# EAGLE design ESP181A (EAGLE 9.6.2)
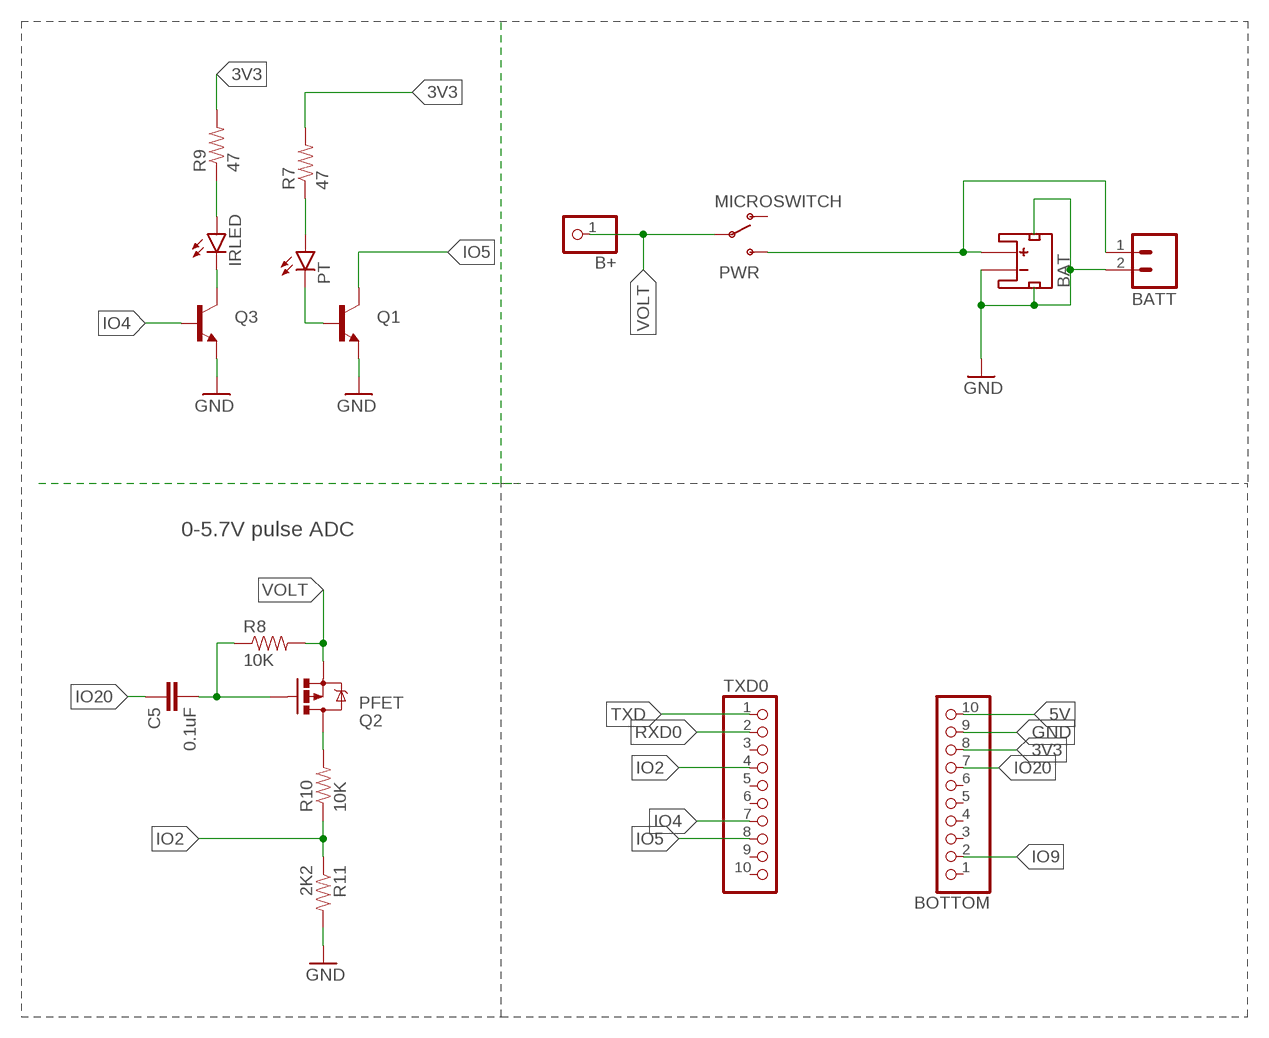
[diagram p0: schematic, sheet 1]

## Parts
B+  PINHD-1X1  [1X01]
BAT  JST1.25MM  [JST_1.25MM]
BATT  M02PTH  [1X02]
BOTTOM  PINHD-1X10  [1X10]
C5  0.1uF  CAP  [0805-CAP]
IRLED  LED3MM  [LED3MM]
PT  LED3MM  [LED3MM]
PWR  MICROSWITCH  [MICROSWITCH]
Q1  TRANSISTOR_NPNSOT23-3  [SOT23-3]
Q2  PFET  MOSFET-PCHANNEL  [SOT23-3]
Q3  TRANSISTOR_NPNSOT23-3  [SOT23-3]
R7  47  RESISTOR0805-RES  [0805]
R8  10K  RESISTOR0805-RES  [0805]
R9  47  RESISTOR0805-RES  [0805]
R10  10K  RESISTOR0805-RES  [0805]
R11  2K2  RESISTOR0805-RES  [0805]
TXD0  PINHD-1X10  [1X10]

## Nets
3V3: BOTTOM.8 R7.2 R9.2
5V: BOTTOM.10
GND: BAT.1(-) BAT.NC1(PAD1) BAT.NC2(PAD2) BATT.2 BOTTOM.9 Q1.2(E) Q3.2(E) R11.2
IO2: R10.1 R11.1 TXD0.4
IO4: Q3.1(B) TXD0.7
IO5: Q1.3(C) TXD0.8
IO9: BOTTOM.2
IO20: BOTTOM.7 C5.1
N$1: IRLED.A R9.1
N$2: PT.K(C) Q1.1(B)
N$5: BAT.2(+) BATT.1 PWR.3(S)
N$11: PT.A R7.1
N$12: C5.2 Q2.1(G) R8.1
N$13: Q2.3(D) R10.2
N$14: IRLED.K(C) Q3.3(C)
RXD0: TXD0.2
TXD: TXD0.1
VOLT: B+.1 PWR.2(P) Q2.2(S) R8.2
Unconnected: BOTTOM.1 BOTTOM.3 BOTTOM.4 BOTTOM.5 BOTTOM.6 PWR.1(O) TXD0.3 TXD0.5 TXD0.6 TXD0.9 TXD0.10

## Notes on the sheet
- 0-5.7V pulse ADC

## Library data of the parts
B+ = pinhead:PINHD-1X1: PIN HEADER
BAT = CuriousTech:JST1.25MM
BATT = SparkFun-Connectors:M02: Standard 2-pin 0.1" header. Use with - straight break away headers ( PRT-00116) - right angle break away headers (PRT-00553) - swiss pins (PRT-00743) - machine pins (PRT-00117) - female headers (PRT-00115) Molex polarized connector foot print use with: PRT-08233 with associated crimp pins and housings. 2.54_SCREWTERM for use with PRT-10571. 3.5mm Screw Terminal footprints for PRT-08084 5mm Screw Terminal footprints for use with PRT-08432
BOTTOM TXD0 = pinhead:PINHD-1X10: PIN HEADER
C5 = SparkFun-Capacitors:CAP: Capacitor Standard 0603 ceramic capacitor, and 0.1" leaded capacitor.
IRLED PT = SparkFun-LED:LED: LEDs Standard schematic elements and footprints for 5mm, 3mm, 1206, and 0603 sized LEDs. 5mm - Spark Fun Electronics SKU : COM-00529 (and others); PROD_ID: DIO-08794
PWR = CuriousTech:MICROSWITCH: 2 pole micro switch
Q1 Q3 = SparkFun-DiscreteSemi:TRANSISTOR_NPN: Generic NPN BJT MMBT2222A - TRANS-08049 (SOT-23, 1A 40V) MPSA42 - TRANS-09116 (SOT-23, 500mA 300V) MMBT5088LT1G - TRANS-11160 (SOT-23, 50 mA 30V) BC547 - COM-08928 <http://www.sparkfun.com/products/8928> (TO-92 45V 100mA) (1.Collector 2.Base 3.Emitter) 2N3904 - COM-00521 <http://www.sparkfun.com/products/521> (TO-92 40V 200mA) (1.Emitter 2.Base 3.Collector) P2N2222A - COM-12852 <http://www.sparkfun.com/products/12852> (TO-92 40V 600mA) (1.Collector 2.Base 3.Emitter); PROD_ID: TRANS-08049
Q2 = SparkFun-DiscreteSemi:MOSFET-PCHANNEL: Generic PMOSFET IRLML2244 - TRANS-11153 (SOT-23 -20V -4.3A) (1.Gate 2.Source 3.Drain) FQP27P06 - COM-10349 <http://www.sparkfun.com/products/10349> (TO-220 -60V -27A) (1.Gate 2.Source 3.Drain); PROD_ID: TRANS-08285
R7-R11 = SparkFun-Resistors:RESISTOR: Resistor Basic schematic elements and footprints for 0603, 1206, and PTH resistors.

## Board
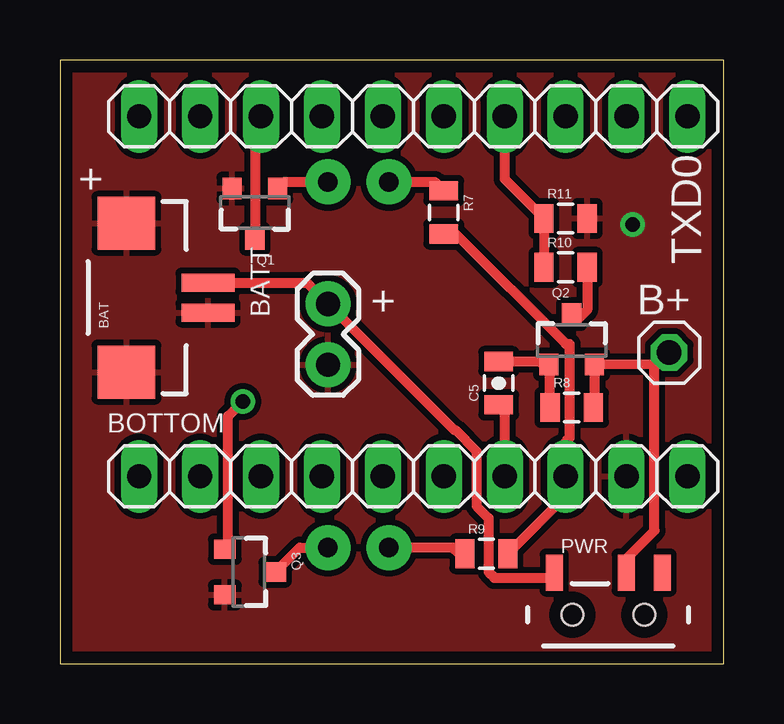
[diagram p1: board, top side]
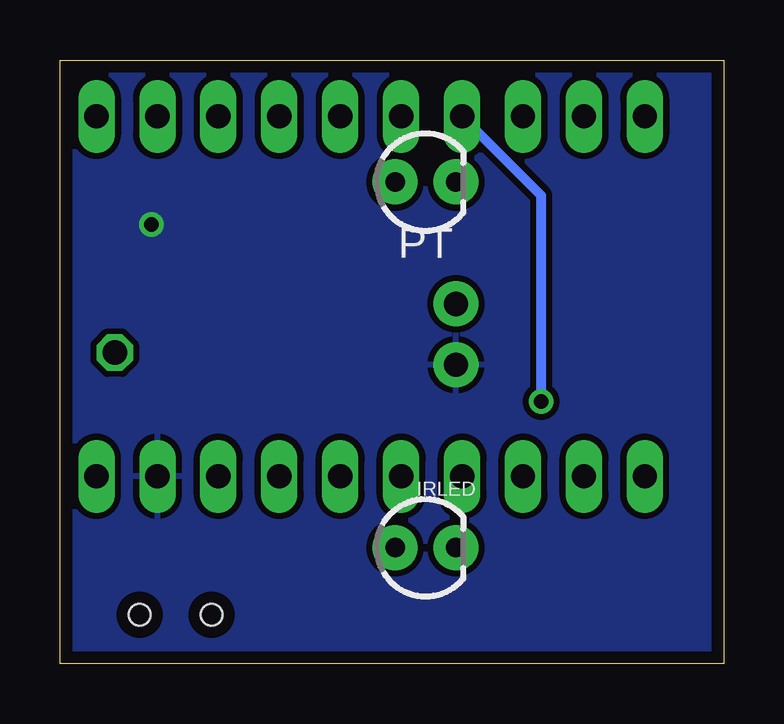
[diagram p2: board, bottom side, seen from below]

Size 27.69 x 25.15 mm. Coordinates in mm from the lower left corner, seen from the top.
Outline: 27.69,0 27.69,25.15 0,25.15 0,0 27.69,0
Copper layers (1*16): Top 0.035mm / dielectric 1.5mm / Bottom 0.035mm
Design rules "default *": minimum track width 10mil, minimum drill 24mil, track to track 8mil, track to pad 8mil, pad to pad 8mil, via to via 8mil, smd to smd 8mil, copper to edge 20mil, drill to drill 8mil, minimum pad ring 10mil, minimum via ring 8mil, stop-mask expansion 4mil, vias tented up to drill 0mil, thermal gap 10mil

### Footprints (pad centres in the part's own frame; a part is rotated, then mirrored left to right if it is on the bottom)
1X01 = drill 1.016 octagon: 1 0,0
JST_1.25MM = smd 0.75 x 2.2: 1 -0.625,-1.6; 2 0.625,-1.6 | smd 2.2 x 2.4: NC1 -3.1,1.8; NC2 3.1,1.8
1X02 = drill 1.016 pad 1.88: 1 0,0; 2 2.54,0
1X10 = drill 1.016 long: 1 -11.43,0; 2 -8.89,0; 3 -6.35,0; 4 -3.81,0; 5 -1.27,0; 6 1.27,0; 7 3.81,0; 8 6.35,0; 9 8.89,0; 10 11.43,0
0805-CAP = smd 0.8 x 1.2: 1 -0.9,0; 2 0.9,0
LED3MM = drill 0.813 pad 1.88: A -1.27,0; K 1.27,0
MICROSWITCH = smd 0.7 x 1.5: 1 -2.25,-1.75; 2 -0.75,-1.75; 3 2.25,-1.75 | hole 0.9: -1.5,0; 1.5,0
SOT23-3 = smd 0.8 x 0.9: 1 -0.95,-1; 2 0.95,-1; 3 0,1.1
0805 = smd 0.8 x 1.2: 1 -0.9,0; 2 0.9,0

### Placement (x,y rotation side)
B+  25.4,12.95 0 top
BAT  4.57,15.24 90 top
BATT  11.18,14.99 270 top
BOTTOM  14.73,7.8 0 top
C5  18.29,11.68 90 top
IRLED  12.45,4.83 0 bottom
PT  12.45,20.07 0 bottom
PWR  22.86,2.03 180 top
Q1  8.13,18.8 180 top
Q2  21.34,13.46 0 top
Q3  7.87,3.81 270 top
R7  16,18.8 270 top
R8  21.34,10.67 0 top
R9  17.78,4.57 0 top
R10  21.08,16.51 0 top
R11  21.08,18.54 0 top
TXD0  14.73,22.8 180 top

### Tracks (layer width: path | path; a pad name or v marks a point on that pad's centre or on a via)
3V3
  Top 0.406: R9.2 21.08,6.97 BOTTOM.8 21.08,9.23 21.24,9.39 21.24,13.32 21.09,13.32 16.51,17.9 R7.2
GND  (via drill 0.61)
  other vias: 23.88,18.29
  pour Top (isolate 0.254): 0,0 0,25.15 27.69,25.15 27.69,0
  pour Bottom (isolate 0.254): 27.69,0 0,0 0,25.15 27.69,25.15
IO2
  Top 0.406: R10.1 R11.1 18.54,20.18 TXD0.4
IO4  (via drill 0.61)
  Top 0.406: Q3.1 6.87,4.64 7.01,4.78 7.01,10.31 v7.62,10.92
  Bottom 0.406: v7.62,10.92 7.62,19.5 TXD0.7
IO5
  Top 0.406: Q1.3 8.13,22.55 TXD0.8
IO20
  Top 0.406: BOTTOM.7 18.54,10.53 C5.1
N$1
  Top 0.406: IRLED.A 16.39,4.83 16.65,4.57 R9.1
N$2
  Top 0.406: Q1.1 9.35,20.07 PT.K
N$5
  Top 0.406: BAT.2 10.3,15.87 BATT.1 16.43,9.73 16.49,9.73 17.37,8.84 17.37,6.55 17.87,6.05 17.87,3.8 18.11,3.57 20.39,3.57 PWR.3
N$11
  Top 0.406: PT.A 15.63,20.07 R7.1
N$12
  Top 0.406: 20.5,12.58 20.44,12.35 | R8.1 20.44,12.35 | C5.2 20.13,12.58 20.13,12.46 Q2.1 20.44,12.41 20.44,12.35
N$13
  Top 0.406: Q2.3 21.57,14.32 21.98,14.73 R10.2
N$14
  Top 0.406: Q3.3 9.99,4.83 IRLED.K
VOLT
  Top 0.406: PWR.2 23.61,4.36 24.79,5.54 24.79,12.34 B+.1 24.94,12.49 Q2.2 22.29,10.72 R8.2

### Text on the board
tPlace: + | +
bStop: CuriousTech.net